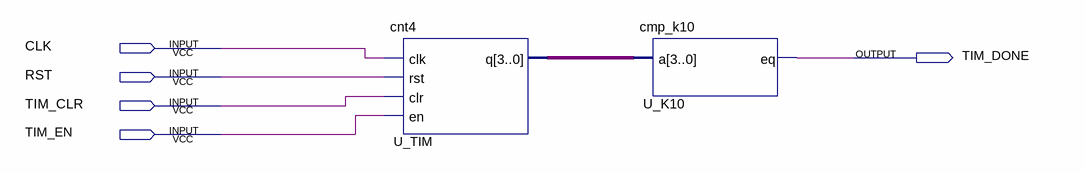
[diagram p0: schematic sheet]
// Quartus schematic tim_block.bdf as structural Verilog: 2 symbols, 5 pins
module tim_block (
  input  CLK,
  input  RST,
  input  TIM_CLR,
  input  TIM_EN,
  output TIM_DONE
);

  wire [3:0] U_TIM_q;

  cnt4 U_TIM (.clk(CLK), .rst(RST), .clr(TIM_CLR), .en(TIM_EN), .q(U_TIM_q));
  cmp_k10 U_K10 (.a(U_TIM_q), .eq(TIM_DONE));
endmodule
